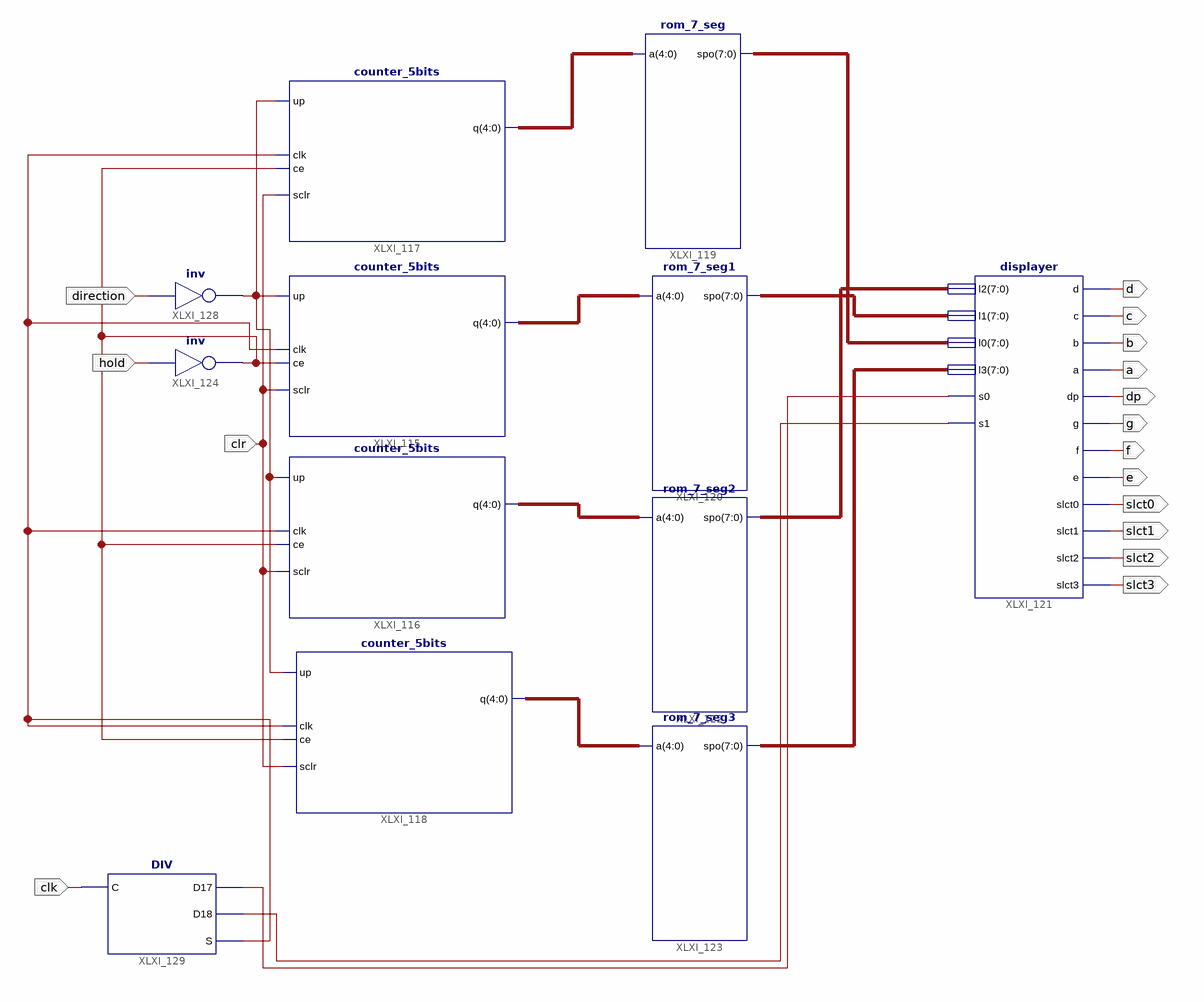
[diagram p0: schematic sheet 1]
// Xilinx ISE schematic main.sch (spartan3e) as structural Verilog: 12 symbols, 16 ports
module main (
  input  clr,
  input  hold,
  input  direction,
  input  clk,
  output a,
  output b,
  output c,
  output d,
  output dp,
  output e,
  output f,
  output g,
  output slct0,
  output slct1,
  output slct2,
  output slct3
);

  wire XLXN_260, XLXN_263, XLXN_268, XLXN_270, XLXN_271;
  wire [4:0] XLXN_242, XLXN_243, XLXN_244, XLXN_245;
  wire [7:0] XLXN_246, XLXN_247, XLXN_248, XLXN_249;

  counter_5bits XLXI_115 (.up(XLXN_260), .clk(XLXN_268), .ce(XLXN_263), .sclr(clr), .q(XLXN_243));
  counter_5bits XLXI_116 (.up(XLXN_260), .clk(XLXN_268), .ce(XLXN_263), .sclr(clr), .q(XLXN_244));
  counter_5bits XLXI_117 (.up(XLXN_260), .clk(XLXN_268), .ce(XLXN_263), .sclr(clr), .q(XLXN_242));
  counter_5bits XLXI_118 (.up(XLXN_260), .clk(XLXN_268), .ce(XLXN_263), .sclr(clr), .q(XLXN_245));
  rom_7_seg XLXI_119 (.a(XLXN_242), .spo(XLXN_246));
  rom_7_seg1 XLXI_120 (.a(XLXN_243), .spo(XLXN_247));
  displayer XLXI_121 (
    .a(a), .b(b), .c(c), .d(d), .dp(dp), .e(e), .f(f), .g(g), .l0(XLXN_246), .l1(XLXN_247), .l2(XLXN_248),
    .l3(XLXN_249), .s0(XLXN_270), .s1(XLXN_271), .slct0(slct0), .slct1(slct1), .slct2(slct2), .slct3(slct3));
  rom_7_seg2 XLXI_122 (.a(XLXN_244), .spo(XLXN_248));
  rom_7_seg3 XLXI_123 (.a(XLXN_245), .spo(XLXN_249));
  not XLXI_124 (XLXN_263, hold);
  not XLXI_128 (XLXN_260, direction);
  DIV XLXI_129 (.C(clk), .D17(XLXN_270), .D18(XLXN_271), .S(XLXN_268));
endmodule
